# EasyEDA Pro project VL53L1.epro

# Schematic L1
Board Name: VL53L5; Create Date: 2025-04-04; Page Name: P1; Project Name: ProDoc_VL53L1_2026-03-30; Schematic Name: L1; Update Date: 2026-02-14; BladeWidth: 10; Company: 嘉立创EDA; Page Size: A4; RegionStart: 1; ShowBorder: 1; TitleBlock: 1; TitleBlockPosition: 3; Version: V1.0; XRegionCount: 6; YRegionCount: 4
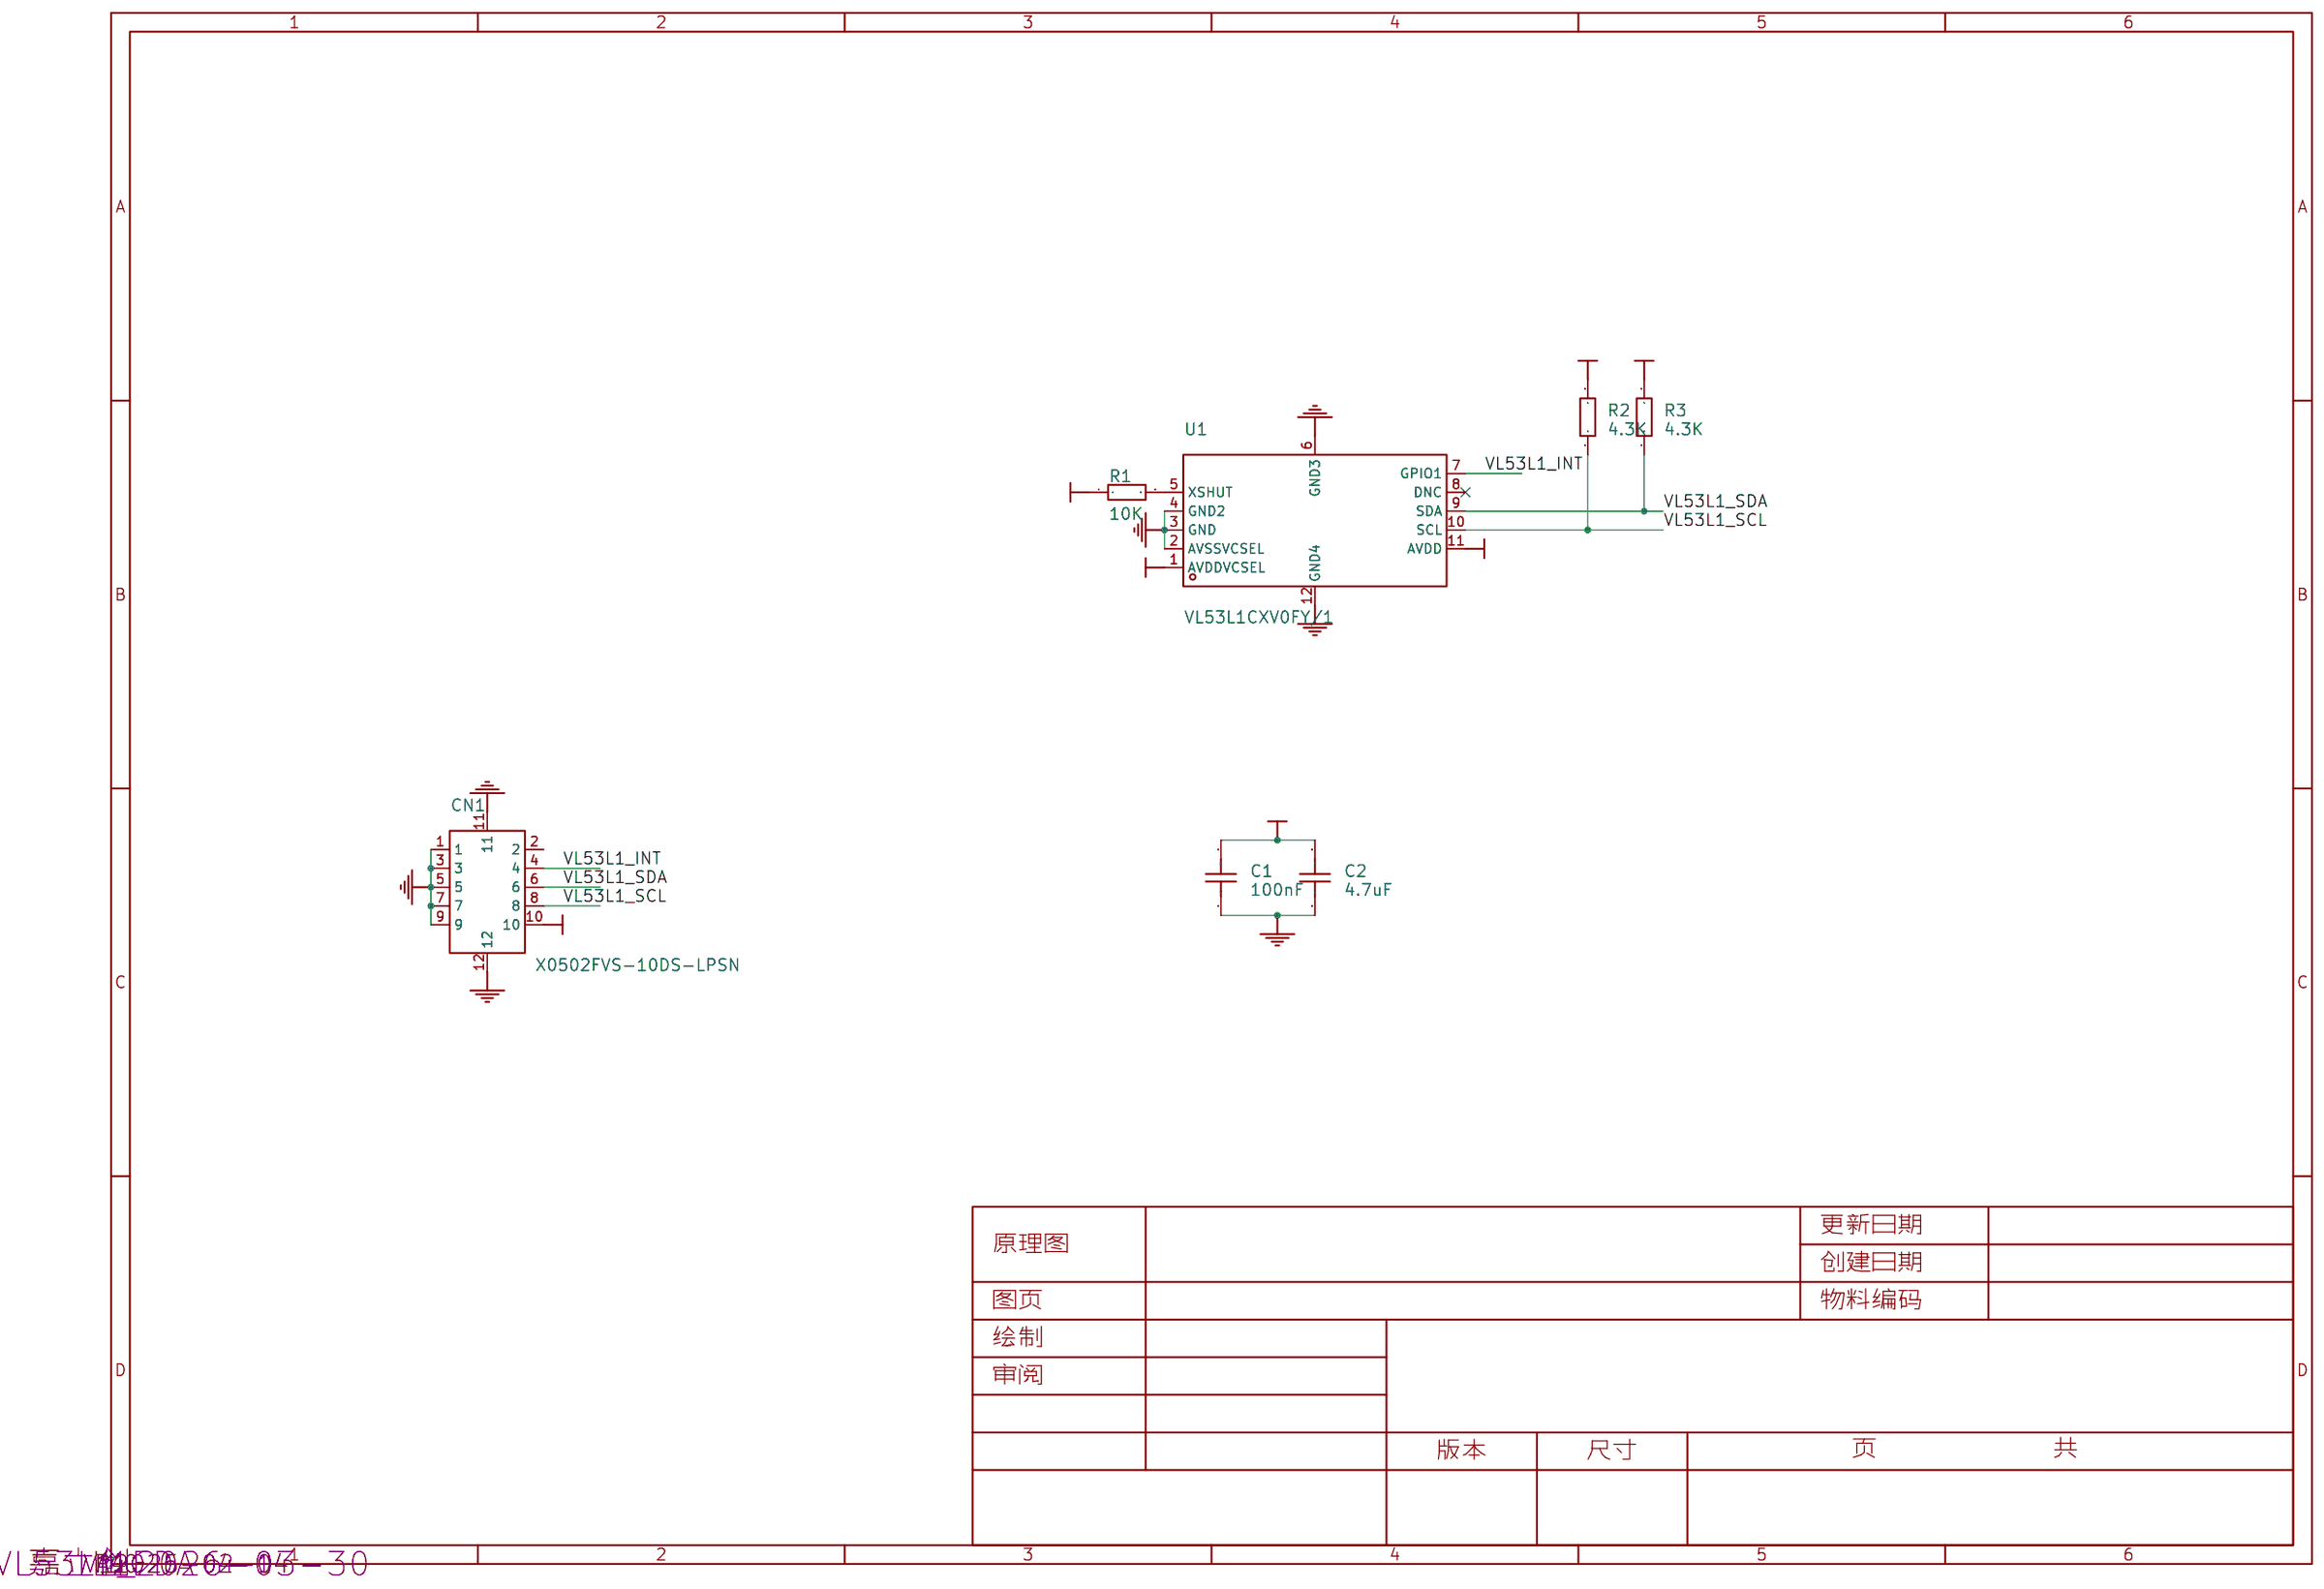
[diagram p0: schematic sheet]

## Parts
C1  100nF  [C0402]
C2  4.7uF  [C0402]
CN1  X0502FVS-10DS-LPSN  [CONN-SMD_10P-P0.50_X0502FVS-10DS-LPSN]
R1  10K  [R0402]
R2  4.3K  [R0402]
R3  4.3K  [R0402]
U1  VL53L1CXV0FY/1  [OPTO-SMD_VL53L1CXV0FY-1]

## Library data of the parts
C1 C2 = CAP_0402: Supplier Footprint: 0402
CN1 = X0502FVS-10DS-LPSN: PIN总数:10P;间距:0.5mm;安装方式:立贴;排数:2;额定电流:300mA;工作温度:-40℃~+125℃;; LCSC Part Name: PIN:10P 间距:0.5mm 立贴; Supplier Part: C21261238; Manufacturer: XKB Connection(中国星坤); Supplier Footprint: SMD,P=0.5mm; JLCPCB Part Class: Extended Part; Datasheet: https://item.szlcsc.com/datasheet/X0502FVS-10DS-LPSN/22679970.html; Supplier: LCSC; Number of Pins: 10P; Pitch: 0.5mm; Mounting Type: 立贴; Number of Rows: 2; Current Rating: 300mA; Voltage Rating: 100V; Connection Type: 槽型对接; Contact Material: 铜合金; Operating Temperature: -40℃~+125℃
R1-R3 = Res_0402: Supplier Footprint: 0402
U1 = VL53L1CXV0FY/1: 线性范围:4m;; Supplier Part: C190004; Manufacturer: ST(意法半导体); Supplier Footprint: LGA-12(2.5x4.9); JLCPCB Part Class: Extended Part; Datasheet: https://atta.szlcsc.com/upload/public/pdf/source/20180403/C190004_0741FA17F5A8F41A8273E0771692B843.pdf; Supplier: LCSC; Supply Voltage: 2.6V~3.5V; Iinearity Range: 4m

## Nets
GND: C1.1 C2.1 CN1.1 CN1.3 CN1.5 CN1.7 CN1.9 CN1.11 CN1.12 U1.2(AVSSVCSEL) U1.3(GND) U1.4(GND2) U1.6(GND3) U1.12(GND4)
VCC: C1.2 C2.2 CN1.10 R1.1 R2.2 R3.2 U1.1(AVDDVCSEL) U1.11(AVDD)
VL53L1_INT: CN1.4 U1.7(GPIO1)
VL53L1_SCL: CN1.8 R2.1 U1.10(SCL)
VL53L1_SDA: CN1.6 R3.1 U1.9(SDA)
$1N1531: R1.2 U1.5(XSHUT)

Not connected (* = marked no-connect by the designer): CN1 2; U1 8(DNC)*

# Board L1
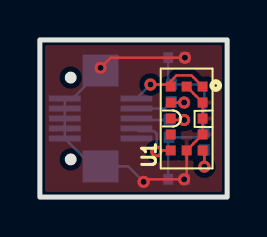
[diagram p1: board, top side]
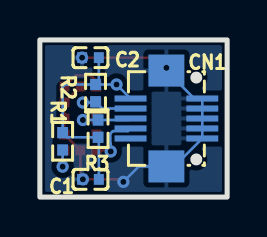
[diagram p2: board, bottom side, seen from below]

Outline 9.4 x 7.87 mm; copper layers: Top Layer, Bottom Layer. Coordinates in mm from the lower left corner of the outline.
Outline path: rectangle 0,7.87 9.4,0
Stack: Top Layer 0.035mm / Dielectric1 1.51mm FR4 er 4.5 / Bottom Layer 0.035mm

## Design rules (mm)
spacing copperThickness1oz (default): track to track 0.102, other pairs 0.152 to 0.3
spacing copperThickness2oz: track to track 0.203, other pairs 0.152 to 0.3
spacing Copper_copperRegion: track to track 0.102, other pairs 0.152 to 0.3
spacing Plane_innerPlane: track to track 0.102, other pairs 0.152 to 0.3
track width copperThickness1oz (default): min 0.127, default 0.127, max 2.54
differential pair differentialPair (default): width min 0.127, default 0.254, max 2.54; gap min 0.152, default 0.152
net GND uses copperRegion_copperThickness1oz
pour e9 uses Copper_copperRegion, copperRegion_Copper_copperRegion
pour e30 uses Copper_copperRegion, copperRegion_Copper_copperRegion

## Placement (name value [footprint] x y rotation side)
C1  100nF  [C0402]  6.86 0.89 180 bottom
C2  4.7uF  [C0402]  6.86 6.98 180 bottom
CN1  X0502FVS-10DS-LPSN  [CONN-SMD_10P-P0.50_X0502FVS-10DS-LPSN]  3.05 3.94 90 bottom
R1  10K  [R0402]  8.25 2.79 270 bottom
R2  4.3K  [R0402]  6.6 5.21 90 bottom
R3  4.3K  [R0402]  6.48 3.43 270 bottom
U1  VL53L1CXV0FY/1  [OPTO-SMD_VL53L1CXV0FY-1]  7.37 3.94 90 top

## Footprints (pads in the part's own frame, mm; a bottom-side part is the same pattern mirrored in y, then rotated)
C0402
  rect 0.5x0.54 smd: 1(-0.42,0) 2(0.42,0)
CONN-SMD_10P-P0.50_X0502FVS-10DS-LPSN
  rect 0.3x1.6 smd: 1(-1,-1.8) 2(-1,1.8) 3(-0.5,-1.8) 4(-0.5,1.8) 5(0,-1.8) 6(0,1.8) 7(0.5,-1.8) 8(0.5,1.8) 9(1,-1.8) 10(1,1.8)
  rect 1.6x1.8 smd: 11(-2.4,0) 12(2.4,0)
OPTO-SMD_VL53L1CXV0FY-1
  rect 0.5x0.5 smd: 1(1.6,-0.8) 2(0.8,-0.8) 3(0,-0.8) 4(-0.8,-0.8) 5(-1.6,-0.8) 6(-1.6,0) 7(-1.6,0.8) 8(-0.8,0.8) 9(0,0.8) 10(0.8,0.8) 11(1.6,0.8) 12(1.6,0)
R0402
  rect 0.566x0.54 smd: 1(-0.433,0) 2(0.433,0)

## Nets
As in the schematic.

Pads without a net: CN1 2; U1 8

## Via types
v1: diameter 0.61, hole 0.305, Top Layer to Bottom Layer, 9 vias

## Routing (per net, layer and track width the routed paths; a pad name or vN(x,y) marks a point on that pad's centre or on a via; arc(x,y) is an arc through that point)
GND: length 21.3
  Top Layer w0.127: v1(5.21,0.76) 5.33,0.89 v1(7.24,0.89) 7.37,1.02 U1.6 7.7,2.67 7.7,2.68 7.83,2.8 7.83,2.8 U1.4 U1.3 U1.2 7.83,5.07 7.83,5.07 7.7,5.2 7.7,5.2 U1.12 ; v1(7.28,6.98) 3.56,6.98 v1(3.05,6.48)
  Bottom Layer w0.127: v1(5.21,0.76) 4.43,1.54 CN1.11 2.65,1.54 CN1.1 CN1.3 CN1.5 CN1.7 CN1.9 1.65,4.94 CN1.12 v1(3.05,6.48) ; v1(7.24,0.89) C1.1
VCC: length 14.7
  Top Layer w0.127: v1(5.55,5.64) 6.46,5.64 U1.11 6.57,5.8 6.86,6.1 7.61,6.1 7.7,6 7.71,6 7.83,5.88 7.83,5.87 U1.1
  Bottom Layer w0.127: 6.6,5.64 8.13,5.64 8.25,5.51 R1.1 8.02,3 R3.2 6.44,2.96 C1.2 ; 6.6,5.64 v1(5.55,5.64) CN1.10 ; 6.6,5.64 6.44,5.81 C2.2
VL53L1_INT: length 2.8
  Top Layer w0.127: U1.7 5.89,2.34 v1(5.84,2.29)
  Bottom Layer w0.127: CN1.4 4.98,3.3 5.74,3.3 5.86,3.18 5.86,2.7 5.84,2.68 v1(5.84,2.29)
VL53L1_SCL: length 3.2
  Top Layer w0.127: U1.10 v1(7.24,4.74)
  Bottom Layer w0.127: CN1.8 6.27,4.44 R2.1 6.64,4.74 v1(7.24,4.74)
VL53L1_SDA: length 3.1
  Top Layer w0.127: U1.9 6.64,3.86 v1(7.24,3.86)
  Bottom Layer w0.127: v1(7.24,3.86) R3.1 4.92,3.86 CN1.6
$1N1531: length 1.7
  Top Layer w0.127: v1(8.25,1.52) 8.25,2.25 U1.5
  Bottom Layer w0.127: R1.2 v1(8.25,1.52)

## Copper pours and planes (outline as drawn; the poured copper is in the pictures)
GND on Top Layer: 0,7.87 9.4,7.87 9.4,0 0,0
GND on Bottom Layer: 0,7.87 9.4,7.87 9.4,0 0,0
